# Altium schematic sheet TMC6100_Section.SchDoc: =Projectname
size A4; SheetNumber: 3; SheetTotal: 7
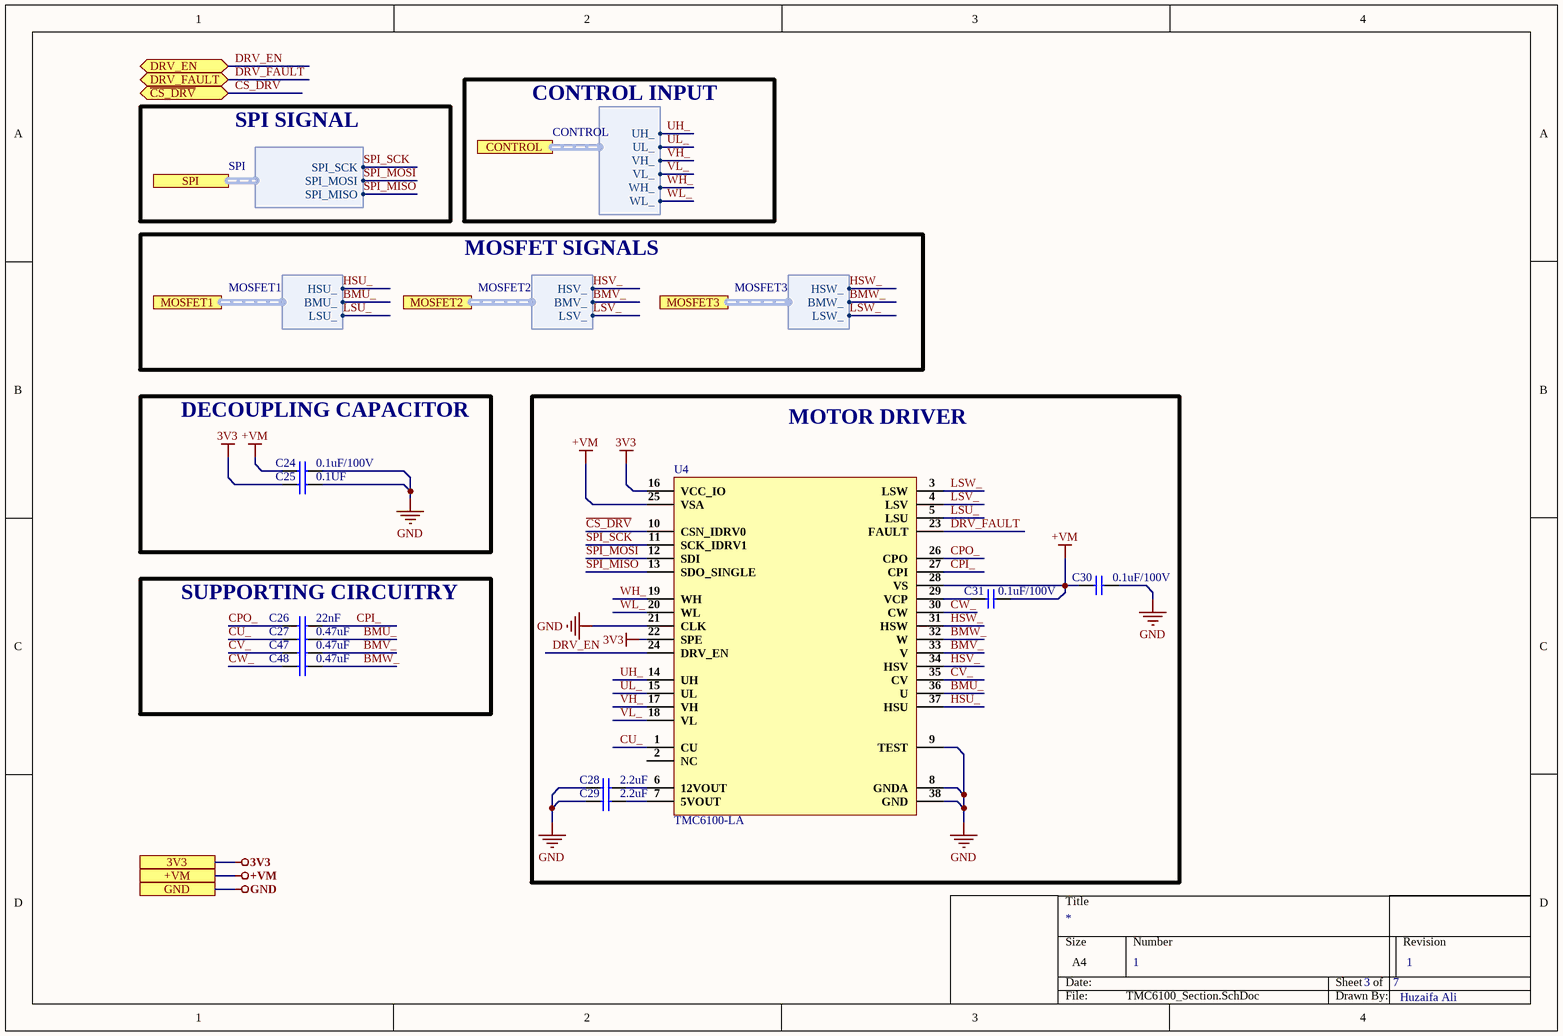
[diagram p0: TMC6100_Section.SchDoc]

## Parts
C24  0.1uF/100V  [Cap0603]
C25  0.1UF  [Cap0402]
C26  22nF  [Cap0603]
C27  0.47uF  [Cap0603]
C28  2.2uF  [Cap0603]
C29  2.2uF  [Cap0603]
C30  0.1uF/100V  [Cap0603]
C31  0.1uF/100V  [Cap0603]
C47  0.47uF  [Cap0603]
C48  0.47uF  [Cap0603]
U4  TMC6100-LA  [37-QFN-EP (7x7)]

## Blocks framed on the sheet
DECOUPLING CAPACITOR: C24 C25
MOTOR DRIVER: C28-C31 U4
SUPPORTING CIRCUITRY: C26 C27 C47 C48

## Ports
3V3, +VM, CONTROL (harness CONTROL), DRV_EN (bidir), DRV_FAULT (bidir), GND, MOSFET1 (harness MOSFET1), MOSFET2 (harness MOSFET2), MOSFET3 (harness MOSFET3), SPI (harness SPI), ~{CS_DRV} (bidir)

## Harnesses
SPI: SPI_SCK, SPI_MOSI, SPI_MISO
CONTROL: UH_, UL_, VH_, VL_, WH_, WL_
MOSFET1: HSU_, BMU_, LSU_
MOSFET2: HSV_, BMV_, LSV_
MOSFET3: HSW_, BMW_, LSW_

## Nets
3V3: C25.1 U4.16(VCC_IO) U4.22(SPE) ; port 3V3
+VM: C24.1 C30.1 C31.2 U4.25(VSA) U4.28(VS) ; port +VM
GND: C24.2 C25.2 C28.1 C29.1 C30.2 U4.8(GNDA) U4.9(TEST) U4.21(CLK) U4.38(GND) ; port GND
~{CS_DRV}: U4.10(CSN_IDRV0) ; port ~{CS_DRV}
BMU_: C27.2 U4.36(U) ; port MOSFET1.BMU_
BMV_: C47.2 U4.33(V) ; port MOSFET2.BMV_
BMW_: C48.2 U4.32(W) ; port MOSFET3.BMW_
CPI_: C26.2 U4.27(CPI)
CPO_: C26.1 U4.26(CPO)
CU_: C27.1 U4.1(CU)
CV_: C47.1 U4.35(CV)
CW_: C48.1 U4.30(CW)
DRV_EN: U4.24(DRV_EN) ; port DRV_EN
DRV_FAULT: U4.23(FAULT) ; port DRV_FAULT
HSU_: U4.37(HSU) ; port MOSFET1.HSU_
HSV_: U4.34(HSV) ; port MOSFET2.HSV_
HSW_: U4.31(HSW) ; port MOSFET3.HSW_
LSU_: U4.5(LSU) ; port MOSFET1.LSU_
LSV_: U4.4(LSV) ; port MOSFET2.LSV_
LSW_: U4.3(LSW) ; port MOSFET3.LSW_
SPI_MISO: U4.13(SDO_SINGLE) ; port SPI.SPI_MISO
SPI_MOSI: U4.12(SDI) ; port SPI.SPI_MOSI
SPI_SCK: U4.11(SCK_IDRV1) ; port SPI.SPI_SCK
UH_: U4.14(UH) ; port CONTROL.UH_
UL_: U4.15(UL) ; port CONTROL.UL_
VH_: U4.17(VH) ; port CONTROL.VH_
VL_: U4.18(VL) ; port CONTROL.VL_
WH_: U4.19(WH) ; port CONTROL.WH_
WL_: U4.20(WL) ; port CONTROL.WL_
NetC28_2: C28.2 U4.6(12VOUT)
NetC29_2: C29.2 U4.7(5VOUT)
NetC31_1: C31.1 U4.29(VCP)

Not connected (* = marked no-connect by the designer): U4 2(NC)

## Notes on the sheet
- CONTROL INPUT
- SPI SIGNAL
- MOSFET SIGNALS
- 1
- Huzaifa Ali

## Library data of the parts
C24 C30 C31 = CC0603KRX7R0BB104: CAP CER 0.1UF 100V X7R 0603; Manufacturer: Yageo; Capacitance: 100nF; Tolerance: 10%; Supplier 1: Digi-Key; Manufacturer Part Number: CC0603KRX7R0BB104; RoHS: Yes; Category: Ceramic Capacitors; Stock 1: 60476; Pricing 1: 1=0.19000, 10=0.13500, 50=0.07680, 100=0.06370, 500=0.04466, 1000=0.03696 (USD); Mount: Surface Mount; Case/Package: 0603; Case Code (Metric): 1608; Case Code (Imperial): 0603; Weight: 7.1E-05oz; Min Operating Temperature: -55°C; Max Operating Temperature: 125°C; Package Quantity: 4000; Voltage Rating: 100V; Packaging: Tape and Reel; Dielectric: X7R; Termination: SMD/SMT; Resistor Type: Ceramic; Voltage Rating (DC): 100V; Series: CC; Length: 0.063inch; Width: 0.031inch; Thickness: 0.035inch; Depth: 0.8mm; Lead Free: Lead Free; RoHS Compliant: Yes; ComponentLink1URL: https://datasheet.ciiva.com/6277/mlccorderingcode-6277030.pdf?src-supplier=Digi-Key; ComponentLink1Description: https://datasheet.ciiva.com/6277/mlccorderingcode-6277030.pdf?src-supplier=Digi-Key; ComponentLink2URL: https://datasheet.ciiva.com/6277/mlccorderingcode-6277081.pdf?src-supplier=Digi-Key; ComponentLink2Description: https://datasheet.ciiva.com/6277/mlccorderingcode-6277081.pdf?src-supplier=Digi-Key; ComponentLink3URL: https://datasheet.ciiva.com/6277/mlccorderingcode-6277082.pdf?src-supplier=Digi-Key; ComponentLink3Description: https://datasheet.ciiva.com/6277/mlccorderingcode-6277082.pdf?src-supplier=Digi-Key; Supplier Part Number 1: 311-1523-1-ND
C25 = CL05B104KB54PNC: CAP CER 0.1UF 50V X7R 0402; Manufacturer: Samsung; Supplier 1: Digi-Key; Manufacturer Part Number: CL05B104KB54PNC; Stock 1: 8594; Pricing 1: 1=0.1, 10=0.067, 50=0.0366, 100=0.0299, 500=0.02138, 1000=0.01681, 2500=0.01528, 5000=0.01406 (USD); Supplier Part Number 1: 1276-CL05B104KB54PNCDKR-ND
C26 = C0603C223K1RAC7867: CAP CER 22nF 100V X7R 0603; Manufacturer: KEMET; Manufacturer Part Number: C0603C223K1RACTU; Dielectric Material: Ceramic; Tolerance: 10%; Dissipation Factor: 2.5%; Supplier 1: Arrow Electronics; RoHS: Yes; Category: Ceramic Capacitors; Stock 1: 108000; Pricing 1: 4000=0.03660 (USD); Mount: Surface Mount,PCB; Case/Package: 0603; Number of Pins: 2; Case Code (Metric): 1608; Case Code (Imperial): 0603; Min Operating Temperature: -55°C; Max Operating Temperature: 125°C; Capacitance: 22nF; Dielectric: X7R; Package Quantity: 4000; Voltage Rating: 100V; Packaging: Tape and Reel; Voltage Rating (DC): 100V; Termination: SMD/SMT; Series: C; Construction: Flat; Voltage: 100V; Length: 1.6mm; Width: 0.031inch; Height: 0.8mm; Thickness: 0.034inch; Depth: 0.8mm; Lead Pitch: 0.7mm; Radiation Hardening: No; RoHS Compliant: Yes; REACH SVHC: No SVHC; ComponentLink1URL: https://datasheet.ciiva.com/5416/kem-c1002-x7r-smd-5416629.pdf?src-supplier=Mouser; ComponentLink1Description: https://datasheet.ciiva.com/5416/kem-c1002-x7r-smd-5416629.pdf?src-supplier=Mouser; ComponentLink2URL: https://datasheet.ciiva.com/18192/getdatasheetpartid-306025-18192903.pdf?src-supplier=Verical; ComponentLink2Description: https://datasheet.ciiva.com/18192/getdatasheetpartid-306025-18192903.pdf?src-supplier=Verical; ComponentLink3URL: https://datasheet.ciiva.com/18101/getdatasheetpartid-38414-18101194.pdf?src-supplier=Verical; ComponentLink3Description: https://datasheet.ciiva.com/18101/getdatasheetpartid-38414-18101194.pdf?src-supplier=Verical; Supplier Part Number 1: C0603C223K1RACTU
C27 C47 C48 = UMK107B7474KA-TR: CAP CER 0.47uF 50V X7R 0603; Manufacturer: Taiyo Yuden; Tolerance: 10%; Capacitance: 470nF; Supplier 1: Digi-Key; Manufacturer Part Number: UMK107B7474KA-TR; RoHS: Yes; Category: Ceramic Capacitors; Stock 1: 81; Pricing 1: 1=0.21000, 10=0.14800, 50=0.08400, 100=0.06950, 500=0.04876, 1000=0.04036 (USD); Mount: Surface Mount; Case/Package: 0603; Case Code (Metric): 1608; Case Code (Imperial): 0603; Min Operating Temperature: -55°C; Max Operating Temperature: 125°C; Packaging: Tape and Reel; Voltage Rating: 50V; Package Quantity: 1; Dielectric: X7R; Termination: SMD/SMT; Voltage: 50V; Series: M; Voltage Rating (DC): 50V; Construction: Flat; Length: 1.6mm; Width: 0.031inch; Height: 0.8mm; Depth: 0.8mm; Thickness: 0.035inch; Radiation Hardening: No; RoHS Compliant: Yes; Lead Free: Lead Free; Halogen Free: Halogen Free; ComponentLink1URL: https://datasheet.ciiva.com/30063/972umk107b7474ka-tr-30063804.pdf?src-supplier=Onlinecomponents.com; ComponentLink1Description: https://datasheet.ciiva.com/30063/972umk107b7474ka-tr-30063804.pdf?src-supplier=Onlinecomponents.com; ComponentLink2URL: https://datasheet.ciiva.com/11600/umk107b7474ka-tr-ss-11600367.pdf?src-supplier=Avnet; ComponentLink2Description: https://datasheet.ciiva.com/11600/umk107b7474ka-tr-ss-11600367.pdf?src-supplier=Avnet; ComponentLink3URL: https://datasheet.ciiva.com/15922/257umk107b7474ka-tr-15922607.pdf?src-supplier=Onlinecomponents.com; ComponentLink3Description: https://datasheet.ciiva.com/15922/257umk107b7474ka-tr-15922607.pdf?src-supplier=Onlinecomponents.com; ComponentLink4URL: https://datasheet.ciiva.com/6274/mlcc-all-e-6274710.pdf?src-supplier=Digi-Key; ComponentLink4Description: https://datasheet.ciiva.com/6274/mlcc-all-e-6274710.pdf?src-supplier=Digi-Key; ComponentLink5URL: https://datasheet.ciiva.com/5412/mlcc01-e-5412119.pdf?src-supplier=Mouser; ComponentLink5Description: https://datasheet.ciiva.com/5412/mlcc01-e-5412119.pdf?src-supplier=Mouser; ComponentLink6URL: https://datasheet.ciiva.com/6274/mlcc-all-e-6274712.pdf?src-supplier=Digi-Key; ComponentLink6Description: https://datasheet.ciiva.com/6274/mlcc-all-e-6274712.pdf?src-supplier=Digi-Key; ComponentLink7URL: https://datasheet.ciiva.com/6274/mlcc-all-e-6274713.pdf?src-supplier=Digi-Key; ComponentLink7Description: https://datasheet.ciiva.com/6274/mlcc-all-e-6274713.pdf?src-supplier=Digi-Key; Supplier Part Number 1: 587-3170-1-ND
C28 C29 = CL10A225KO8NNNC: CAP CER 2.2UF 16V X5R 0603; Manufacturer: Samsung; Material: Ceramic; Tolerance: 10%; Supplier 1: Digi-Key; Manufacturer Part Number: CL10A225KO8NNNC; Stock 1: 421786; Pricing 1: 1=0.13, 10=0.092, 100=0.0435, 500=0.03048, 1000=0.02524 (USD); Mount: Surface Mount; Case/Package: 0603; Case Code (Metric): 1608; Case Code (Imperial): 0603; Contact Plating: Tin; Min Operating Temperature: -55°C; Max Operating Temperature: 85°C; Capacitance: 2.2uF; Dielectric: X5R; Packaging: Tape and Reel; Package Quantity: 4000; Voltage Rating: 16V; Voltage: 16V; Voltage Rating (DC): 16V; Length: 1.6mm; Height: 0.8mm; Width: 0.031inch; Thickness: 0.035inch; Depth: 0.8mm; Radiation Hardening: No; Lead Free: Lead Free; ComponentLink1URL: https://www.verical.com/server-webapp/html/getDatasheet?partID=355165&src-supplier=Verical; ComponentLink1Description: https://www.verical.com/server-webapp/html/getDatasheet?partID=355165&src-supplier=Verical; ComponentLink2URL: http://www.samsungsem.com/kr/support/product-search/mlcc/__icsFiles/afieldfile/2016/08/18/S_CL10A225KO8NNNC.pdf?src-supplier=Digi-Key; ComponentLink2Description: http://www.samsungsem.com/kr/support/product-search/mlcc/__icsFiles/afieldfile/2016/08/18/S_CL10A225KO8NNNC.pdf?src-supplier=Digi-Key; ComponentLink3URL: http://www1.futureelectronics.com/doc/SAMSUNG%20PASSIVE/CL05B104KQ5NNNC.pdf?src-supplier=Future+Electronics; ComponentLink3Description: http://www1.futureelectronics.com/doc/SAMSUNG%20PASSIVE/CL05B104KQ5NNNC.pdf?src-supplier=Future+Electronics; ComponentLink4URL: https://produktinfo.conrad.com/datenblaetter/450000-474999/457919-da-01-en-VS_KONDENSATOR_0603.pdf?src-supplier=Conrad; ComponentLink4Description: https://produktinfo.conrad.com/datenblaetter/450000-474999/457919-da-01-en-VS_KONDENSATOR_0603.pdf?src-supplier=Conrad; Supplier Part Number 1: 1276-1040-1-ND
U4 = TMC6100-LA: GATE DRIVER IC 8-60V QFN37; Manufacturer: Trinamic; Supplier 1: Mouser; Manufacturer Part Number: TMC6100-LA; RoHS: No; Stock 1: 19; Pricing 1: 1=4.30000, 10=3.65000, 50=3.65000, 100=3.00000, 250=2.69000, 416=2.59000, 832=2.15000, 1000=2.15000, 2912=2.07000, 5408=2.00000, 10000=2.07000, 10400=1.95000 (USD); Supplier Part Number 1: 700-TMC6100LA